# Altium schematic sheet Connectors-SW-LEDs-Sheet.SchDoc
size A4; SheetNumber: 11; SheetTotal: 11
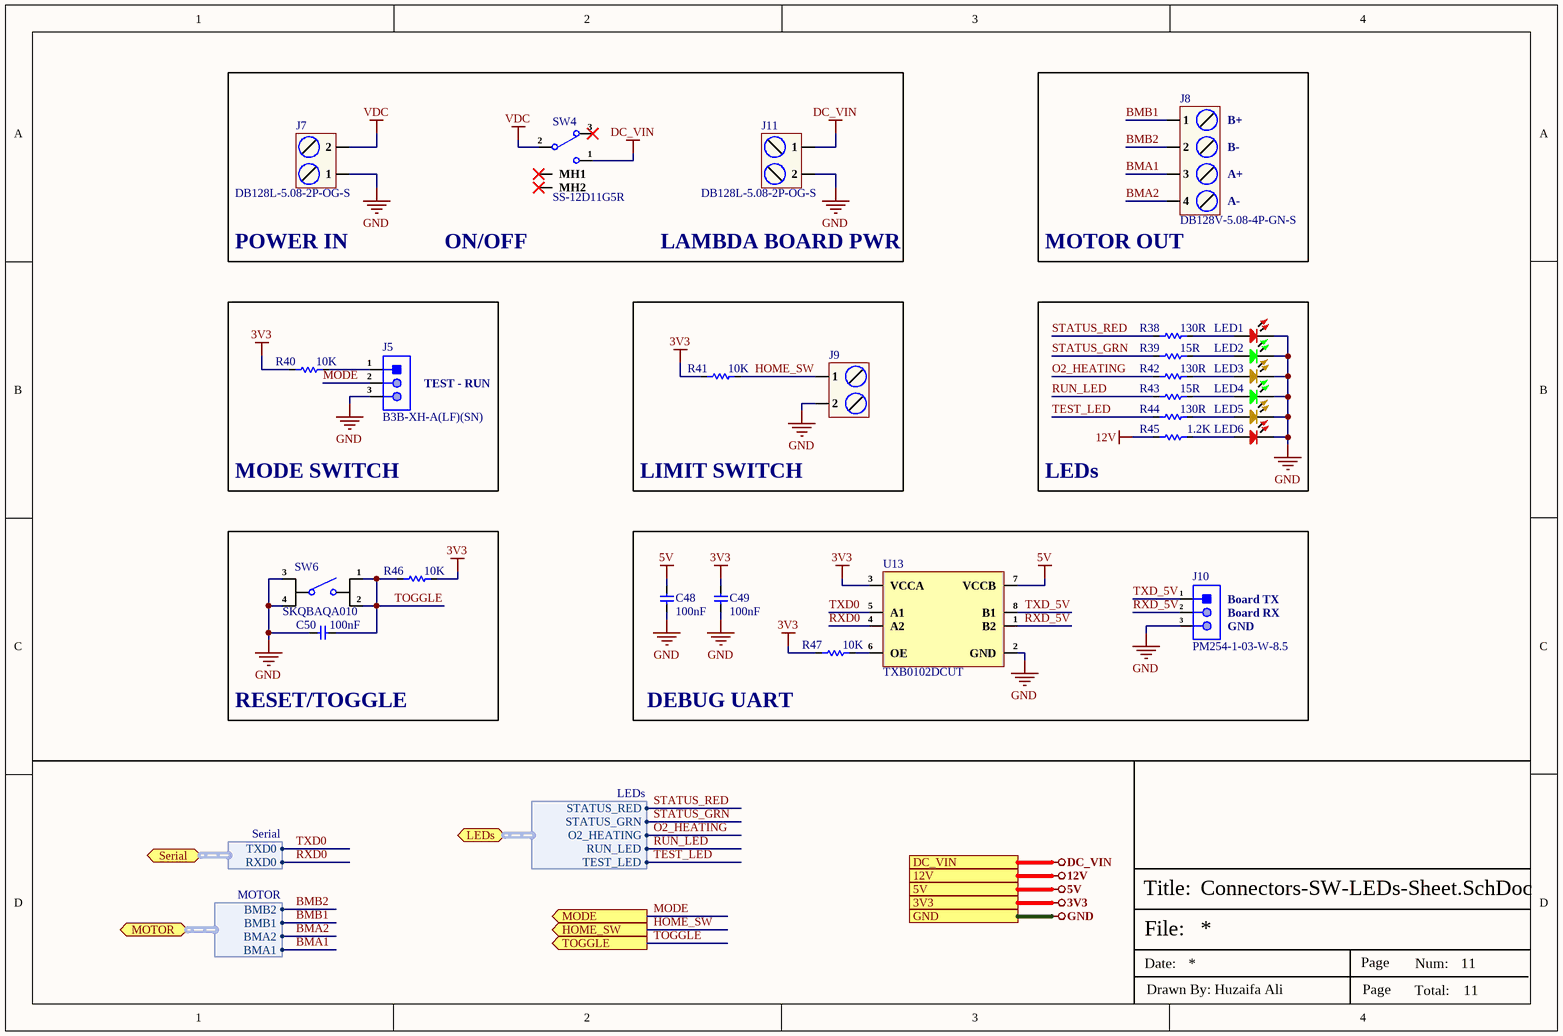
[diagram p0: Connectors-SW-LEDs-Sheet.SchDoc]

## Parts
C48  100nF  [Cap-0603]
C49  100nF  [Cap-0603]
C50  100nF  [Cap-0603]
J5  B3B-XH-A(LF)(SN)  [B3B-XH-A(LF)(SN)_]
J7  DB128L-5.08-2P-OG-S  [DB128L-5.08-2P-OG-S]
J8  DB128V-5.08-4P-GN-S  [DB128V-5.08-4P-GN-S]
J9  DB128L-5.08-2P-GY-S  [DB128L-5.08-2P-GY-S]  (value not drawn)
J10  PM254-1-03-W-8.5  [HDR 1x3 Female Right angle (2.54mm)]
J11  DB128L-5.08-2P-OG-S  [DB128L-5.08-2P-OG-S]
LED1  RED  [TH LED Red 3MM]  (value not drawn)
LED2  Emerald  [TH LED 3mm_]  (value not drawn)
LED3  LTL17KFL5D-012A  [TH LED 3mm_]  (value not drawn)
LED4  Emerald  [TH LED 3mm_]  (value not drawn)
LED5  LTL17KFL5D-012A  [TH LED 3mm_]  (value not drawn)
LED6  RED  [TH LED Red 3MM]  (value not drawn)
R38  130R  [Res-0603]
R39  15R  [Res-0603]
R40  10K  [Res-0603]
R41  10K  [Res-0603]
R42  130R  [Res-0603]
R43  15R  [Res-0603]
R44  130R  [Res-0603]
R45  1.2K  [Res-0603]
R46  10K  [Res-0603]
R47  10K  [Res-0603]
SW4  SS-12D11G5R  [SS-12D11G5R_]
SW6  SKQBAQA010  [SKQBAQA010]
U13  TXB0102DCUT  [TXB0102DCUT]

## Blocks framed on the sheet
MOTOR OUT: J8
MODE SWITCH: J5 R40
LIMIT SWITCH: J9 R41
LEDs: LED1-LED6 R38 R39 R42-R45
RESET/TOGGLE: C50 R46 SW6
DEBUG UART: C48 C49 J10 R47 U13

## Ports
3V3 (see Top-Sheet[4B], 0-24mA-Input-Sheet[3D], 01M21V00-Sensor-Sheet[3D], 20x4-Display-Sheet[3D], Controller-Sheet[3D], Optical-Encoder-Sheet[3D], Power-Sheet[3D], Stepper-Driver-Sheet[3D]), 5V (see Top-Sheet[4B], 01M21V00-Sensor-Sheet[3D], 20x4-Display-Sheet[3D], Optical-Encoder-Sheet[3D], Power-Sheet[3D]), 12V (see Top-Sheet[4B], Buzzer-Sheet[3D], Power-Sheet[3D], Relay-Sheet[3D], Stepper-Driver-Sheet[3D]), DC_VIN (see Top-Sheet[4C], Power-Sheet[3D]), GND (see Top-Sheet[4B], 0-24mA-Input-Sheet[3D], 01M21V00-Sensor-Sheet[3D], 20x4-Display-Sheet[3D], Buzzer-Sheet[3D], Controller-Sheet[3D], Optical-Encoder-Sheet[3D], Power-Sheet[3D], Relay-Sheet[3D], Stepper-Driver-Sheet[3D]), HOME_SW (out, see Top-Sheet[3B], Controller-Sheet[3D]), LEDs (bidir, harness LEDs, see Top-Sheet[3C], Controller-Sheet[1D]), MODE (out, see Top-Sheet[3B], Controller-Sheet[3D]), MOTOR (bidir, harness MOTOR, see Top-Sheet[3C], Stepper-Driver-Sheet[2D]), Serial (bidir, harness Serial, see Top-Sheet[3C], Controller-Sheet[2D]), TOGGLE (out, see Top-Sheet[3B], Controller-Sheet[3D])

## Harnesses
Serial: TXD0, RXD0
MOTOR: BMB2, BMB1, BMA2, BMA1
LEDs: STATUS_RED, STATUS_GRN, O2_HEATING, RUN_LED, TEST_LED

## Nets
3V3: C49.1 R40.2 R41.2 R46.1 R47.2 U13.3(VCCA) ; port 3V3
5V: C48.1 U13.7(VCCB) ; port 5V
12V: R45.1 ; port 12V
DC_VIN: J11.1 SW4.1 ; port DC_VIN
GND: C48.2 C49.2 C50.2 J5.3 J7.1 J9.2 J10.3 J11.2 LED1.2 LED2.1(-) LED3.1(-) LED4.1(-) LED5.1(-) LED6.2 SW6.3 SW6.4 U13.2(GND) ; port GND
VDC: J7.2 SW4.2
BMA1: J8.3 ; port MOTOR.BMA1
BMA2: J8.4 ; port MOTOR.BMA2
BMB1: J8.1 ; port MOTOR.BMB1
BMB2: J8.2 ; port MOTOR.BMB2
HOME_SW: J9.1 R41.1 ; port HOME_SW
MODE: J5.2 ; port MODE
O2_HEATING: R42.1 ; port LEDs.O2_HEATING
RUN_LED: R43.1 ; port LEDs.RUN_LED
RXD0: U13.4(A2) ; port Serial.RXD0
RXD_5V: J10.2 U13.1(B2)
STATUS_GRN: R39.1 ; port LEDs.STATUS_GRN
STATUS_RED: R38.1 ; port LEDs.STATUS_RED
TEST_LED: R44.1 ; port LEDs.TEST_LED
TOGGLE: C50.1 R46.2 SW6.1 SW6.2 ; port TOGGLE
TXD0: U13.5(A1) ; port Serial.TXD0
TXD_5V: J10.1 U13.8(B1)
NetJ5_1: J5.1 R40.1
NetLED1_1: LED1.1 R38.2
NetLED2_2: LED2.2(+) R39.2
NetLED3_2: LED3.2(+) R42.2
NetLED4_2: LED4.2(+) R43.2
NetLED5_2: LED5.2(+) R44.2
NetLED6_1: LED6.1 R45.2
NetR47_1: R47.1 U13.6(OE)

Not connected (* = marked no-connect by the designer): SW4 3* MH1* MH2*

## Notes on the sheet
- (near J8) B+
- (near J8) A+
- (near J8) B-
- POWER IN
- ON/OFF
- LAMBDA BOARD PWR
- (near J8) A-
- (near J5) TEST - RUN
- (near J10) Board TX
- (near J10) Board RX
- (near J10) GND
- File:
- Title:
- Date:
- Page
- Num:
- Total:
- Drawn By: Huzaifa Ali

## Library data of the parts
C48-C50 = CC0603KRX5R9BB104: CAP CER 0.1UF 50V X5R 0603; Manufacturer: Yageo; Tolerance: 10%; Item Type: Capacitor; Supplier 1: Digi-Key; Manufacturer Part Number: CC0603KRX5R9BB104; RoHS: Yes; Category: Ceramic Capacitors; Stock 1: 152253; Pricing 1: 1=0.10000, 10=0.05200, 50=0.02820, 100=0.02310, 500=0.01648, 1000=0.01294 (USD); Mount: Surface Mount; Case/Package: 0603; Case Code (Imperial): 0603; Case Code (Metric): 1608; Weight: 7.1E-05oz; Min Operating Temperature: -55°C; Max Operating Temperature: 85°C; Capacitance: 100nF; Packaging: Tape and Reel; Voltage Rating: 50V; Dielectric: X5R; Termination: SMD/SMT; Voltage Rating (DC): 50V; Package Quantity: 4000; Length: 0.063inch; Width: 0.031inch; Thickness: 0.035inch; Lead Free: Lead Free; Halogen Free: Halogen Free; ComponentLink1URL: http://www.mouser.com/ds/2/447/Yageo_UPY-GP_NP0_16V-to-50V_9-358835.pdf?src-supplier=Mouser; ComponentLink1Description: http://www.mouser.com/ds/2/447/Yageo_UPY-GP_NP0_16V-to-50V_9-358835.pdf?src-supplier=Mouser; ComponentLink2URL: https://www.yageo.com/upload/media/product/productsearch/datasheet/mlcc/UPY-GPHC_X5R_4V-to-50V_26.pdf?src-supplier=Digi-Key; ComponentLink2Description: https://www.yageo.com/upload/media/product/productsearch/datasheet/mlcc/UPY-GPHC_X5R_4V-to-50V_26.pdf?src-supplier=Digi-Key; ComponentLink3URL: http://www.yageo.com/exep/pages/download/literatures/ProductSelectionGuide%202014_Final_2.pdf?src-supplier=Digi-Key; ComponentLink3Description: http://www.yageo.com/exep/pages/download/literatures/ProductSelectionGuide%202014_Final_2.pdf?src-supplier=Digi-Key; Supplier Part Number 1: 311-4046-1-ND; LCSC Part Number: C110022
J5 = B3B-XH-A(LF)(SN): CONN HEADER VERT 3POS 2.5MM; Manufacturer: JST; Current Rating: 3A; Number of Positions: 3; Connector Type: Male Pin; Voltage Rating (AC): 250V; Contact Resistance: 20mR; Insulation Resistance: 1GR; Gender: Male; Wire/Cable Gauge: 22AWG; Item Type: JST Connector; Supplier 1: Farnell; Manufacturer Part Number: B3B-XH-A(LF)(SN); RoHS: Yes; Category: Headers and Wire Housings; Stock 1: 114254; Pricing 1: 100=0.09250, 500=0.07700, 1000=0.06470, 2500=0.06340, 5000=0.06210, 10000=0.06080 (GBP); Mount: Through Hole; Contact Plating: Tin,Lead,Copper; Contact Material: Brass; Color: Natural; Housing Color: White; Housing Material: Polyamide; Min Operating Temperature: -25°C; Max Operating Temperature: 85°C; Number of Rows: 1; Packaging: Bulk; Termination: Press-Fit; Max Current Rating: 3A; Voltage Rating: 250V; Fastening Type: Detent; Number of Contacts: 3; Max Voltage Rating (AC): 250V; Max Voltage Rating (DC): 250V; Orientation: Straight; Length: 9.9mm; Pitch: 2.5mm; Lead Pitch: 2.5mm; Depth: 5.75mm; Lead Free: Lead Free; REACH SVHC: No SVHC; ComponentLink1URL: https://datasheet.ciiva.com/26894/getdatasheetpartid-640434-26894454.pdf?src-supplier=Verical; ComponentLink1Description: https://datasheet.ciiva.com/26894/getdatasheetpartid-640434-26894454.pdf?src-supplier=Verical; ComponentLink2URL: https://datasheet.ciiva.com/11746/0900766b8082653f-11746520.pdf?src-supplier=RSComponents; ComponentLink2Description: https://datasheet.ciiva.com/11746/0900766b8082653f-11746520.pdf?src-supplier=RSComponents; ComponentLink3URL: https://datasheet.ciiva.com/26894/getdatasheetpartid-440399-26894778.pdf?src-supplier=Verical; ComponentLink3Description: https://datasheet.ciiva.com/26894/getdatasheetpartid-440399-26894778.pdf?src-supplier=Verical; Supplier Part Number 1: 1516277; LCSC Part Number: C144394
J7 J11 = DB128L-5.08-2P-OG-S: 1x2P 18A -40℃~+105℃ 250V Orange 12~30 Straight 5.08mm 2.5 1 2 Plugin,P=5.08mm Screw terminal ROHS; Manufacturer: DORABO; Item Type: Terminal Block; Manufacturer Part Number: DB128L-5.08-2P-OG-S; Package: Plugin,P=5.08mm; LCSC Part Number: C430603; ComponentLink1Description: LCSC; ComponentLink1URL: https://www.lcsc.com/product-detail/Screw-terminal_DORABO-DB128L-5-08-2P-OG-S_C430603.html
J8 = DB128V-5.08-4P-GN-S: 1x4P 20A -40℃~+105℃ 300V Green 12~30 Straight 5.08mm 2.5 1 4 Plugin,P=5.08mm Screw terminal ROHS; Manufacturer: DORABO; Manufacturer Part Number: DB128V-5.08-4P-GN-S; Package: Plugin,P=5.08mm; LCSC Part Number: C2915641; Item Type: Screw terminal; ComponentLink1Description: LCSC; ComponentLink1URL: https://www.lcsc.com/product-detail/Screw-terminal_DORABO-DB128V-5-08-4P-GN-S_C2915641.html
J9 = DB128L-5.08-2P-GY-S: 1x2P 20A -40℃~+105℃ 300V Gray 12~30 Straight 5.08mm 1~2.5 1 2 Plugin,P=5.08mm Screw terminal ROHS; Manufacturer: DORABO; Item Type: Terminal Block; Manufacturer Part Number: DB128L-5.08-2P-GY-S; Package: Plugin,P=5.08mm; LCSC Part Number: C500021; ComponentLink1Description: LCSC; ComponentLink1URL: https://www.lcsc.com/product-detail/Screw-terminal_DORABO-DB128L-5-08-2P-GY-S_C500021.html
J10 = PM254-1-03-W-8.5: 2.54mm Plugin 3A Copper Alloy 3P -40℃~+105℃ 260℃@5S Right-Angle 1x3P side 8.5mm Square Holes Push-Pull,P=2.54mm Female Headers ROHS; Manufacturer: HCTL; Manufacturer Part Number: PM254-1-03-W-8.5; Package: Push-Pull,P=2.54mm; LCSC Part Number: C2897385; Item Type: Female Header; ComponentLink1Description: LCSC; ComponentLink1URL: *
LED1 LED6 = NFD3401URD: 620nm~630nm -30℃~+85℃ Red 30° 200mW Plugin,D=3mm Light Emitting Diodes (LED) ROHS; Manufacturer: Foshan NationStar Optoelectronics; Manufacturer Part Number: NFD3401URD; Package: Plugin,D=3mm; LCSC Part Number: C20618148; Item Type: LED; ComponentLink1Description: LCSC; ComponentLink1URL: https://www.lcsc.com/product-detail/Light-Emitting-Diodes-LED_Foshan-NationStar-Optoelectronics-NFD3401URD_C20618148.html
LED2 LED4 = NFD3401UGD: 515nm~525nm -30℃~+85℃ Emerald 30° 200mW Plugin,D=3mm Light Emitting Diodes (LED) ROHS; Manufacturer: Foshan NationStar Optoelectronics; Manufacturer Part Number: NFD3401UGD; Package: Plugin,D=3mm; LCSC Part Number: C20618151; Item Type: LED; ComponentLink1Description: LCSC; ComponentLink1URL: https://www.lcsc.com/product-detail/Light-Emitting-Diodes-LED_Foshan-NationStar-Optoelectronics-NFD3401URD_C20618148.html
LED3 LED5 = LTL17KFL5D-012A: 20mA -40℃~+80℃ 605nm Amber Color 50° 3mm圆形灯头 75mW Plugin,D=3mm Light Emitting Diodes (LED) ROHS; Manufacturer: Lite-On; Manufacturer Part Number: LTL17KFL5D-012A; Package: Plugin,D=3mm; LCSC Part Number: C575510; Item Type: LED; ComponentLink1Description: LCSC; ComponentLink1URL: https://www.lcsc.com/product-detail/Light-Emitting-Diodes-LED_Lite-On-LTL17KFL5D-012A_C575510.html
R38 R42 R44 = RC0603FR-07130RL: RES 130 OHM 1% 1/10W 0603; Manufacturer: Yageo; Power Rating: 100mW; Temperature Coefficient: 100ppm/°C; Voltage Rating (DC): 50V; Voltage Rating: 75V; Item Type: Resistor; Supplier 1: Future Electronics; Manufacturer Part Number: RC0603FR-07130RL; RoHS: Yes; Category: Chip SMD Resistors; Stock 1: 630000; Pricing 1: 5000=0.0014, 75000=0.0013, 200000=0.0013, 750000=0.0012, 2000000=0.0011 (USD); Case/Package: 0603; Pins: 2; Case Code (Imperial): 0603; Case Code (Metric): 1608; Weight: 7.1E-05oz; Min Operating Temperature: -55°C; Max Operating Temperature: 155°C; Value: 130R; Tolerance: 1%; Packaging: Tape and Reel; Resistor Type: Thick Film; Termination: SMD/SMT; Number of Terminations: 2; Max Power Dissipation: 100mW; Features: Moisture Resistant; Series: RC; Resistance Tolerance: 1%; Construction: Rectangular; Length: 1.6mm; Width: 0.8mm; Height: 0.45mm; Depth: 0.8mm; Lead Free: Lead Free; Reach SVHC Compliant: No; Military Standard: Not; RoHS Compliant: Yes; ComponentLink1URL: https://datasheet.ciiva.com/46395/443971-46395023.pdf?src-supplier=Element14; ComponentLink1Description: https://datasheet.ciiva.com/46395/443971-46395023.pdf?src-supplier=Element14; ComponentLink2URL: https://datasheet.ciiva.com/2553/pyu-r-int-thick-7-2553516.pdf?src-supplier=Digi-Key; ComponentLink2Description: https://datasheet.ciiva.com/2553/pyu-r-int-thick-7-2553516.pdf?src-supplier=Digi-Key; ComponentLink3URL: https://datasheet.ciiva.com/2553/pyu-r-int-thick-7-2553517.pdf?src-supplier=Digi-Key; ComponentLink3Description: https://datasheet.ciiva.com/2553/pyu-r-int-thick-7-2553517.pdf?src-supplier=Digi-Key; ComponentLink4URL: https://datasheet.ciiva.com/2553/pyu-r-int-thick-7-2553515.pdf?src-supplier=Digi-Key; ComponentLink4Description: https://datasheet.ciiva.com/2553/pyu-r-int-thick-7-2553515.pdf?src-supplier=Digi-Key; Supplier Part Number 1: 1846773; LCSC Part Number: C141677
R39 R43 = RC0603FR-0715RL: RES 15 OHM 1% 1/10W 0603; Manufacturer: Yageo; Voltage Rating (AC): 50V; Current Rating: 50mA; Item Type: Resistor; Supplier: Future Electronics; Supplier Part Number: 6308514; Manufacturer Part Number: RC0603FR-0715RL; RoHS: Yes; Category: Chip SMD Resistors; Stock: 5830000; Pricing: 5000=0.0011, 75000=0.001, 200000=0.001, 500000=0.001, 1250000=0.0009 (USD); Weight: 250mg; Contact Material: 157ConductorMaterial; Lead Free: 5697LeadFree; ComponentLink1URL: https://datasheet.ciiva.com/5989/1686128-5989704.pdf?src-supplier=Farnell; ComponentLink1Description: https://datasheet.ciiva.com/5989/1686128-5989704.pdf?src-supplier=Farnell; ComponentLink2URL: https://datasheet.ciiva.com/8890/pyu-rc0603-51-rohs-l-4-8890742.pdf?src-supplier=Avnet; ComponentLink2Description: https://datasheet.ciiva.com/8890/pyu-rc0603-51-rohs-l-4-8890742.pdf?src-supplier=Avnet; ComponentLink3URL: https://datasheet.ciiva.com/12557/rc0603-272842-12557839.pdf?src-supplier=Mouser; ComponentLink3Description: https://datasheet.ciiva.com/12557/rc0603-272842-12557839.pdf?src-supplier=Mouser; ComponentLink4URL: https://datasheet.ciiva.com/2454/pyu-r-int-thick-7-2454840.pdf?src-supplier=Digikey; ComponentLink4Description: https://datasheet.ciiva.com/2454/pyu-r-int-thick-7-2454840.pdf?src-supplier=Digikey; ComponentLink5URL: https://datasheet.ciiva.com/2454/pyu-r-int-thick-7-2454841.pdf?src-supplier=Digikey; ComponentLink5Description: https://datasheet.ciiva.com/2454/pyu-r-int-thick-7-2454841.pdf?src-supplier=Digikey; ComponentLink6URL: https://datasheet.ciiva.com/2454/pyu-r-int-thick-7-2454842.pdf?src-supplier=Digikey; ComponentLink6Description: https://datasheet.ciiva.com/2454/pyu-r-int-thick-7-2454842.pdf?src-supplier=Digikey; ComponentLink7URL: https://datasheet.ciiva.com/7746/443971-7746262.pdf?src-supplier=Element14; ComponentLink7Description: https://datasheet.ciiva.com/7746/443971-7746262.pdf?src-supplier=Element14; ComponentLink8URL: https://datasheet.ciiva.com/7746/443971-7746263.pdf?src-supplier=Element14; ComponentLink8Description: https://datasheet.ciiva.com/7746/443971-7746263.pdf?src-supplier=Element14; LCSC Part Number: C128059
R40 R41 R46 R47 = RC0603FR-0710KL: RES SMD 10K Ohm 1% 1/10W 0603; Manufacturer: Yageo; Resistance: 10kR; Temperature Coefficient: 100ppm/°C; Voltage Rating (DC): 50V; Power Rating: 100mW; Voltage Rating: 75V; Item Type: Resistor; Supplier 1: Digi-Key; Manufacturer Part Number: RC0603FR-0710KL; RoHS: Yes; Category: Chip SMD Resistors; Stock 1: 25249139; Pricing 1: 1=0.10000, 10=0.02400, 100=0.00970, 1000=0.00436, 2500=0.00378 (USD); Case/Package: 0603; Number of Pins: 2; Case Code (Imperial): 0603; Case Code (Metric): 1608; Weight: 7.1E-05oz; Size Code: 0603; Min Operating Temperature: -55°C; Max Operating Temperature: 155°C; Tolerance: 1%; Resistor Type: Thick Film; Packaging: Tape and Reel; Termination: SMD/SMT; Features: Moisture Resistant; Series: RC; Max Power Dissipation: 100mW; Number of Terminations: 2; Resistance Tolerance: 1%; Construction: Rectangular; Length: 1.6mm; Width: 0.8mm; Height: 0.45mm; Depth: 0.8mm; Lead Pitch: 0.3mm; REACH SVHC: Unknown; Lead Free: Lead Free; Military Standard: Not; RoHS Compliant: Yes; ComponentLink1URL: https://datasheet.ciiva.com/7660/38590-7660789.pdf?src-supplier=Element14; ComponentLink1Description: https://datasheet.ciiva.com/7660/38590-7660789.pdf?src-supplier=Element14; ComponentLink2URL: https://datasheet.ciiva.com/7983/443971-7983596.pdf?src-supplier=Element14; ComponentLink2Description: https://datasheet.ciiva.com/7983/443971-7983596.pdf?src-supplier=Element14; ComponentLink3URL: https://datasheet.ciiva.com/22747/443971-22747519.pdf?src-supplier=Element14; ComponentLink3Description: https://datasheet.ciiva.com/22747/443971-22747519.pdf?src-supplier=Element14; ComponentLink4URL: https://datasheet.ciiva.com/46440/1868787-46440891.pdf?src-supplier=Element14; ComponentLink4Description: https://datasheet.ciiva.com/46440/1868787-46440891.pdf?src-supplier=Element14; ComponentLink5URL: https://datasheet.ciiva.com/7746/1738695-7746239.pdf?src-supplier=Element14; ComponentLink5Description: https://datasheet.ciiva.com/7746/1738695-7746239.pdf?src-supplier=Element14; ComponentLink6URL: https://datasheet.ciiva.com/15189/getdatasheetpartid-409289-15189591.pdf?src-supplier=Verical; ComponentLink6Description: https://datasheet.ciiva.com/15189/getdatasheetpartid-409289-15189591.pdf?src-supplier=Verical; Supplier Part Number 1: 311-10.0KHRCT-ND; LCSC Part Number: C98220
R45 = RC0603FR-071K2L: RES SMD 1.2K OHM 1% 1/10W 0603; Manufacturer: Yageo; Power Rating: 100mW; Voltage Rating (DC): 50V; Resistance: 1.2kR; Temperature Coefficient: 100ppm/°C; Item Type: Resistor; Supplier 1: Digi-Key; Manufacturer Part Number: RC0603FR-071K2L; RoHS: Yes; Category: Chip SMD Resistors; Stock 1: 531140; Pricing 1: 1=0.10000, 10=0.02400, 100=0.00970, 1000=0.00436, 2500=0.00378 (USD); Case/Package: 0603; Number of Pins: 2; Case Code (Imperial): 0603; Case Code (Metric): 1608; Size Code: 0603; Min Operating Temperature: -55°C; Max Operating Temperature: 155°C; Tolerance: 1%; Packaging: Tape and Reel; Voltage Rating: 50V; Termination: SMD/SMT; Resistor Type: Thick Film; Features: Moisture Resistant; Series: RC; Max Power Dissipation: 100mW; Number of Terminations: 2; Construction: Rectangular; Resistance Tolerance: 1%; Length: 1.6mm; Width: 0.8mm; Height: 0.45mm; Depth: 0.8mm; REACH SVHC: No SVHC; Lead Free: Lead Free; Military Standard: Not; RoHS Compliant: Yes; Supplier Part Number 1: 311-1.20KHRCT-ND; LCSC Part Number: C114605
SW4 = SS-12D11G5R: Shrouded 5A SPDT 125V 6.3mm 13.5mm 125V 6.6mm 5A PCPin 10000 Rectangular columnar -40℃~+85℃ Black Plugin Slide Switches ROHS; Manufacturer: XKB Connectivity; Manufacturer Part Number: SS-12D11G5R; Package: Custom; LCSC Part Number: C388633; ComponentLink1Description: LCSC; ComponentLink1URL: https://www.lcsc.com/product-detail/Slide-Switches_XKB-Connectivity-SS-12D11G5R_C388633.html; Item Type: Slide Switch
SW6 = SKQBAQA010: 10mm 23.2mm Round Button 50mA Straight 10mm SPST 12V Plugin Tactile Switches ROHS; Manufacturer: Alps Electric; Item Type: Switch; Operating Force: 1.57N; Supplier: Mouser; LCSC Part Number: C382054; Manufacturer Part Number: SKQBAQA010; RoHS: Yes; Stock: 1720; Pricing: 1=1.19, 10=1.14, 50=1.14, 100=0.93, 1000=0.733, 10000=0.553 (USD); Mounting Technology: Through Hole; Color: Grey; Contact Plating: Silver; Min Operating Temperature: -30°C; Max Operating Temperature: 85°C; Current Rating: 50mA; Packaging: Bulk; Voltage Rating (DC): 12V; Max Current Rating: 50mA; Throw Configuration: SPST; Max Voltage Rating (DC): 12V; Termination: PC Pins; Orientation: Straight; Series: SKQB; Length: 10mm; Depth: 10.3mm; Radiation Hardening: No; Lead Free: Lead Free; RoHS Compliant: Yes; ComponentLink1URL: https://datasheet.ciiva.com/26906/getdatasheetpartid-652286-26906303.pdf?src-supplier=Verical; ComponentLink1Description: https://datasheet.ciiva.com/26906/getdatasheetpartid-652286-26906303.pdf?src-supplier=Verical
U13 = TXB0102DCUT: IC TRNSLTR BIDIRECTIONAL US8; Manufacturer: Texas Instruments; Propagation Delay: 31ns; Min Supply Voltage: 1.65V; Max Supply Voltage: 5.5V; Data Rate: 100Mbps; Number of Channels: 2; Logic Function: Translator; Turn-On Delay Time: 7.4ns; High Level Output Current: -20uA; Low Level Output Current: 20uA; Output Type: 3-STATE; Output Current: 50mA; Supplier 1: Arrow Electronics; Manufacturer Part Number: TXB0102DCUT; RoHS: Yes; Category: Integrated Circuits (ICs); Stock 1: 10; Pricing 1: 1=0.79330, 10=0.66470, 25=0.65820, 250=0.37450, 500=0.36200, 1000=0.29770, 2500=0.28440 (USD); Mount: Surface Mount; Case/Package: VSSOP; Number of Pins: 8; Weight: 0.000339oz; Contact Plating: Gold; Min Operating Temperature: -40°C; Max Operating Temperature: 85°C; Packaging: Tape and Reel; Package Quantity: 1; Number of Bits: 2; Series: -; Number of Inputs: 2; Length: 2.3mm; Width: 2mm; Height: 0.85mm; Radiation Hardening: No; Lead Free: Lead Free; RoHS Compliant: Yes; REACH SVHC: No SVHC; ComponentLink1URL: https://datasheet.ciiva.com/4226/sces641b-4226901.pdf?src-supplier=Arrow+Electronics; ComponentLink1Description: https://datasheet.ciiva.com/4226/sces641b-4226901.pdf?src-supplier=Arrow+Electronics; ComponentLink2URL: https://datasheet.ciiva.com/15096/getdatasheetpartid-226009-15096242.pdf?src-supplier=Verical; ComponentLink2Description: https://datasheet.ciiva.com/15096/getdatasheetpartid-226009-15096242.pdf?src-supplier=Verical; ComponentLink3URL: https://datasheet.ciiva.com/14287/txb0102-14287498.pdf?src-supplier=Avnet; ComponentLink3Description: https://datasheet.ciiva.com/14287/txb0102-14287498.pdf?src-supplier=Avnet; ComponentLink4URL: https://datasheet.ciiva.com/14287/txb0102-14287370.pdf?src-supplier=Avnet; ComponentLink4Description: https://datasheet.ciiva.com/14287/txb0102-14287370.pdf?src-supplier=Avnet; ComponentLink5URL: https://datasheet.ciiva.com/6619/txb0102-6619255.pdf?src-supplier=Digi-Key; ComponentLink5Description: https://datasheet.ciiva.com/6619/txb0102-6619255.pdf?src-supplier=Digi-Key; ComponentLink6URL: https://datasheet.ciiva.com/6619/txb0102-6619256.pdf?src-supplier=Digi-Key; ComponentLink6Description: https://datasheet.ciiva.com/6619/txb0102-6619256.pdf?src-supplier=Digi-Key; ComponentLink7URL: https://datasheet.ciiva.com/6619/txb0102-6619257.pdf?src-supplier=Digi-Key; ComponentLink7Description: https://datasheet.ciiva.com/6619/txb0102-6619257.pdf?src-supplier=Digi-Key; Supplier Part Number 1: TXB0102DCUT